# Altium schematic sheet Reg.SchDoc
size A4
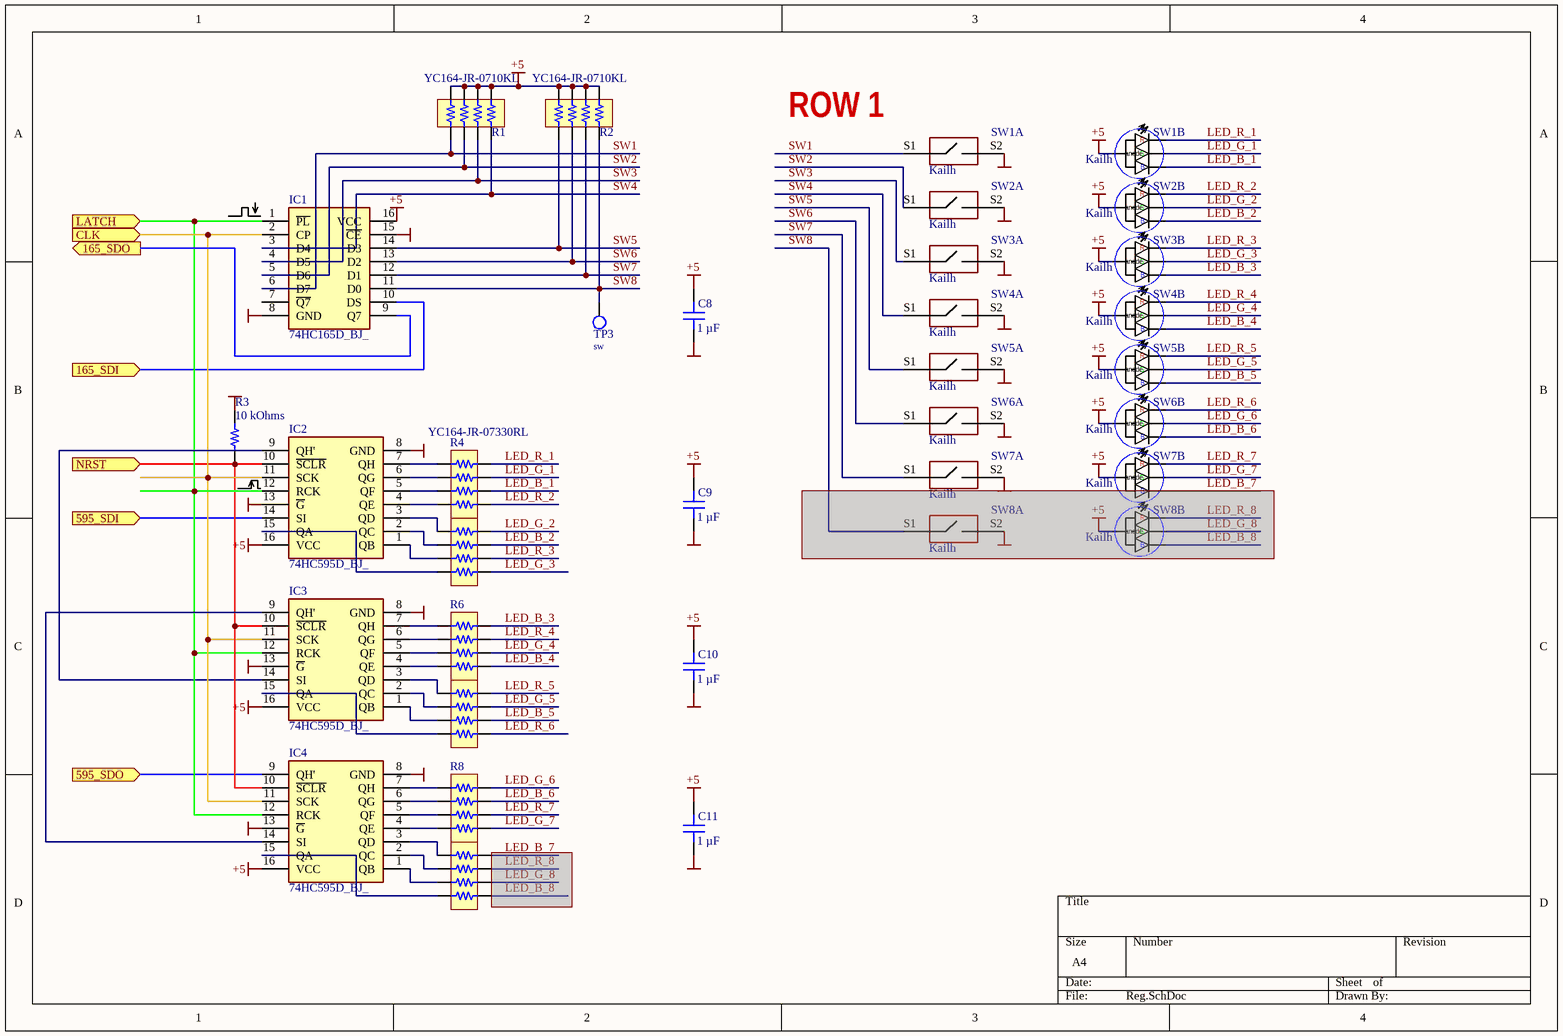
[diagram p0: Reg.SchDoc]

## Parts
C8  1 µF  [CAP 0805_2012]
C9  1 µF  [CAP 0805_2012]
C10  1 µF  [CAP 0805_2012]
C11  1 µF  [CAP 0805_2012]
IC1  74HC165D_BJ_  [SOIC127P600X175-16N]
IC2  74HC595D_BJ_  [SOIC127P600X175-16N]
IC3  74HC595D_BJ_  [SOIC127P600X175-16N]
IC4  74HC595D_BJ_  [SOIC127P600X175-16N]
R1  YC164-JR-0710KL  [RESNET 1206-8 CONVEX]
R2  YC164-JR-0710KL  [RESNET 1206-8 CONVEX]
R3  10 kOhms  [RES 0603_1608]
R4  YC164-JR-07330RL  [RESNET 1206-8 CONVEX]
R5  YC164-JR-07330RL  [RESNET 1206-8 CONVEX]  (value not drawn)
R6  YC164-JR-07330RL  [RESNET 1206-8 CONVEX]  (value not drawn)
R7  YC164-JR-07330RL  [RESNET 1206-8 CONVEX]  (value not drawn)
R8  YC164-JR-07330RL  [RESNET 1206-8 CONVEX]  (value not drawn)
R9  YC164-JR-07330RL  [RESNET 1206-8 CONVEX]  (value not drawn)
SW1  Kailh  [KAILH_MX_SOCKET_smdRGB]  (parts A,B of 2)
SW2  Kailh  [KAILH_MX_SOCKET_smdRGB]  (parts A,B of 2)
SW3  Kailh  [KAILH_MX_SOCKET_smdRGB]  (parts A,B of 2)
SW4  Kailh  [KAILH_MX_SOCKET_smdRGB]  (parts A,B of 2)
SW5  Kailh  [KAILH_MX_SOCKET_smdRGB]  (parts A,B of 2)
SW6  Kailh  [KAILH_MX_SOCKET_smdRGB]  (parts A,B of 2)
SW7  Kailh  [KAILH_MX_SOCKET_smdRGB]  (parts A,B of 2)
SW8  Kailh  [KAILH_MX_SOCKET_smdRGB]  (parts A,B of 2)  (masked out: inside a compile mask, not in the netlist)
TP3  sw  [TESTPOINT_VIA]

## Ports
165_SDI (in), 165_SDO (out), 595_SDI (in), 595_SDO (in), CLK (in), LATCH (in), NRST (in)

## Nets
+5: C8.2 C9.2 C10.2 C11.2 IC1.16(VCC) IC2.16(VCC) IC3.16(VCC) IC4.16(VCC) R1.5 R1.6 R1.7 R1.8 R2.5 R2.6 R2.7 R2.8 SW1.3(anode) SW2.3(anode) SW3.3(anode) SW4.3(anode) SW5.3(anode) SW6.3(anode) SW7.3(anode)
GND: C8.1 C9.1 C10.1 C11.1 IC1.8(GND) IC1.15(~{CE}) IC2.8(GND) IC2.13(~{G}) IC3.8(GND) IC3.13(~{G}) IC4.8(GND) IC4.13(~{G}) R3.2 SW1.S2 SW2.S2 SW3.S2 SW4.S2 SW5.S2 SW6.S2 SW7.S2
165_SDI: IC1.10(DS) ; port 165_SDI
165_SDO: IC1.9(Q7) ; port 165_SDO
595_SDI: IC2.14(SI) ; port 595_SDI
595_SDO: IC4.9(QH') ; port 595_SDO
CLK: IC1.2(CP) IC2.11(SCK) IC3.11(SCK) IC4.11(SCK) ; port CLK
LATCH: IC1.1(~{PL}) IC2.12(RCK) IC3.12(RCK) IC4.12(RCK) ; port LATCH
LED_B_1: R4.2 SW1.4(B)
LED_B_2: R5.3 SW2.4(B)
LED_B_3: R6.4 SW3.4(B)
LED_B_4: R6.1 SW4.4(B)
LED_B_5: R7.2 SW5.4(B)
LED_B_6: R8.3 SW6.4(B)
LED_G_1: R4.3 SW1.2(G)
LED_G_2: R5.4 SW2.2(G)
LED_G_3: R5.1 SW3.2(G)
LED_G_4: R6.2 SW4.2(G)
LED_G_5: R7.3 SW5.2(G)
LED_G_6: R8.4 SW6.2(G)
LED_G_7: R8.1 SW7.2(G)
LED_R_1: R4.4 SW1.1(R)
LED_R_2: R4.1 SW2.1(R)
LED_R_3: R5.2 SW3.1(R)
LED_R_4: R6.3 SW4.1(R)
LED_R_5: R7.4 SW5.1(R)
LED_R_6: R7.1 SW6.1(R)
LED_R_7: R8.2 SW7.1(R)
NRST: IC2.10(~{SCLR}) IC3.10(~{SCLR}) IC4.10(~{SCLR}) R3.1 ; port NRST
SW1: IC1.6(D7) R1.1 SW1.S1
SW2: IC1.5(D6) R1.2 SW2.S1
SW3: IC1.4(D5) R1.3 SW3.S1
SW4: IC1.3(D4) R1.4 SW4.S1
SW5: IC1.14(D3) R2.1 SW5.S1
SW6: IC1.13(D2) R2.2 SW6.S1
SW7: IC1.12(D1) R2.3 SW7.S1
SW8: IC1.11(D0) R2.4 TP3.1
NetIC2_1: IC2.1(QB) R5.7
NetIC2_2: IC2.2(QC) R5.6
NetIC2_3: IC2.3(QD) R5.5
NetIC2_4: IC2.4(QE) R4.8
NetIC2_5: IC2.5(QF) R4.7
NetIC2_6: IC2.6(QG) R4.6
NetIC2_7: IC2.7(QH) R4.5
NetIC2_9: IC2.9(QH') IC3.14(SI)
NetIC2_15: IC2.15(QA) R5.8
NetIC3_1: IC3.1(QB) R7.7
NetIC3_2: IC3.2(QC) R7.6
NetIC3_3: IC3.3(QD) R7.5
NetIC3_4: IC3.4(QE) R6.8
NetIC3_5: IC3.5(QF) R6.7
NetIC3_6: IC3.6(QG) R6.6
NetIC3_7: IC3.7(QH) R6.5
NetIC3_9: IC3.9(QH') IC4.14(SI)
NetIC3_15: IC3.15(QA) R7.8
NetIC4_1: IC4.1(QB) R9.7
NetIC4_2: IC4.2(QC) R9.6
NetIC4_3: IC4.3(QD) R9.5
NetIC4_4: IC4.4(QE) R8.8
NetIC4_5: IC4.5(QF) R8.7
NetIC4_6: IC4.6(QG) R8.6
NetIC4_7: IC4.7(QH) R8.5
NetIC4_15: IC4.15(QA) R9.8

Not connected (* = marked no-connect by the designer): IC1 7(~{Q7}); R9 1 2 3 4; SW7 4(B)

## Notes on the sheet
- ROW 1

## Library data of the parts
C8-C11 = C0805C105K4RAC7800: CAP CER 1UF 16V X7R 0805; manufacturer: KEMET; Tolerance: ±10%; Part Number: C0805C105K4RAC7800; Value: 1 µF; Applications: Bypass, Decoupling; Capacitance: 1 µF; componentlink1description: Datasheet; componentlink1url: https://api.kemet.com/component-edge/download/datasheet/C0805C105K4RACTU.pdf; componentlink2description: DigiKey Link; componentlink2url: https://www.digikey.com/en/products/detail/kemet/C0805C105K4RAC7800/416047; Device Package: 0805 (2012 Metric); lastupdated: 9/19/2022 1:03:30 PM; Lifecycle Status: Active; Minimum Order: 1; Mounting Type: Surface Mount, MLCC; Operating Temperature: -55°C ~ 125°C; Package / Case: 0805 (2012 Metric); packaging: TapeAndReel; partid: 32075; Part Status: Active; price: 0.01; series: SMD Comm X7R; Size / Dimension: 0.079" L x 0.049" W (2.00mm x 1.25mm); Supplier 1: DigiKey; Supplier Part Number 1: 399-C0805C105K4RAC7800CT-ND; Temperature Coefficient: X7R; Thickness (Max): 0.039" (1.00mm); Voltage - Rated: 16V
IC1 = 74HC165D_BJ_: Integrated Circuit; Manufacturer_Name: Toshiba; Manufacturer_Part_Number: 74HC165D(BJ); Datasheet Link: https://www.arrow.com/en/products/74hc165d-bj/toshiba?region=nac; Height: 1.75mm; Mouser Part Number: 757-74HC165DBJ; Mouser Price/Stock: https://www.mouser.co.uk/ProductDetail/Toshiba/74HC165DBJ?qs=lQAVKuKFhkJom8fGze1o7Q%3D%3D; Arrow Part Number: 74HC165D(BJ); Arrow Price/Stock: https://www.arrow.com/en/products/74hc165d-bj/toshiba?region=nac
IC2-IC4 = 74HC595D_BJ_: Integrated Circuit; Manufacturer_Name: Toshiba; Manufacturer_Part_Number: 74HC595D(BJ); Datasheet Link: https://componentsearchengine.com/Datasheets/1/74HC595D(BJ).pdf; Height: 1.75mm; Mouser Part Number: 757-74HC595DBJ; Mouser Price/Stock: https://www.mouser.co.uk/ProductDetail/Toshiba/74HC595DBJ?qs=T%2FywbITssnTkqd02WdSNRg%3D%3D; Arrow Part Number: 74HC595D(BJ); Arrow Price/Stock: https://www.arrow.com/en/products/74hc595d-bj/toshiba?region=nac
R1 R2 = YC164-JR-0710KL: RES ARRAY 4 RES 10K OHM 1206; Manufacturer: Yageo; Circuit Type: Isolated; Number of Resistors: 4; Power Per Element: 62.5mW; Temperature Coefficient: ±200ppm/°C; Tolerance: ±5%; Part Number: YC164-JR-0710KL; Applications: DDRAM, SDRAM; ComponentLink1Description: Datasheet; ComponentLink1URL: https://www.yageo.com/upload/media/product/productsearch/datasheet/rchip/PYu-YC_TC_group_51_RoHS_L_9.pdf; ComponentLink2Description: DigiKey Link; ComponentLink2URL: http://digikey.com/product-detail/en/yageo/YC164-JR-0710KL/YC164J-10KCT-ND/1005702; Height - Seated (Max): 0.028" (0.70mm); LastUpdated: 02.09.2020 1:23:24; Lifecycle Status: Active; Minimum Order: 1; Mounting Type: Surface Mount; Number of Pins: 8; Operating Temperature: -55°C ~ 155°C; Package / Case: 1206 (3216 Metric), Convex, Long Side Terminals; Packaging: TapeAndReel; PartId: 146; Part Status: Active; Price: 0.01; Resistance (Ohms): 10k; Series: YC164; Size / Dimension: 0.126" L x 0.063" W (3.20mm x 1.60mm); Supplier 1: DigiKey; Supplier Part Number 1: YC164J-10KCT-ND
R3 = ERJ-3EKF1002V: RES SMD 10K OHM 1% 1/10W 0603; Manufacturer: Panasonic Electronic Components; Power (Watts): 0.1W, 1/10W; Temperature Coefficient: ±100ppm/°C; Part Number: ERJ-3EKF1002V; Value: 10 kOhms; ComponentLink1Description: Datasheet; ComponentLink1URL: https://industrial.panasonic.com/cdbs/www-data/pdf/RDA0000/AOA0000C304.pdf; ComponentLink2Description: DigiKey Link; ComponentLink2URL: https://www.digikey.com/en/products/detail/panasonic-electronic-components/ERJ-3EKF1002V/196066; Composition: Thick Film; Device Package: 0603 (1608 Metric); Height - Seated (Max): 0.022" (0.55mm); LastUpdated: 2/9/2024 8:41:59 PM; Lifecycle Status: Active; Minimum Order: 1; Number of Terminations: 2; Operating Temperature: -55°C ~ 155°C; Package / Case: 0603 (1608 Metric); Packaging: TapeAndReel; PartId: 25695; Part Status: Active; Price: 0.01; Resistance: 10 kOhms; Series: ERJ-3EK; Size / Dimension: 0.063" L x 0.031" W (1.60mm x 0.80mm); Supplier 1: DigiKey; Supplier Part Number 1: P10.0KHCT-ND; Supplier Device Package: 0603; Tolerance: ±1%; Features: Automotive AEC-Q200; Ratings: AEC-Q200
R4-R9 = YC164-JR-07330RL: RES ARRAY 4 RES 330 OHM 1206; Manufacturer: Yageo; Circuit Type: Isolated; Number of Resistors: 4; Power Per Element: 62.5mW; Resistance (Ohms): 330; Temperature Coefficient: ±200ppm/°C; Tolerance: ±5%; Part Number: YC164-JR-07330RL; Applications: DDRAM, SDRAM; ComponentLink1Description: Datasheet; ComponentLink1URL: https://www.yageo.com/upload/media/product/productsearch/datasheet/rchip/PYu-YC_TC_group_51_RoHS_L_9.pdf; ComponentLink2Description: DigiKey Link; ComponentLink2URL: http://digikey.com/product-detail/en/yageo/YC164-JR-07330RL/YC164J-330CT-ND/1005668; Height - Seated (Max): 0.028" (0.70mm); LastUpdated: 9/2/2020 1:23:24 AM; Lifecycle Status: Active; Minimum Order: 1; Mounting Type: Surface Mount; Number of Pins: 8; Operating Temperature: -55°C ~ 155°C; Package / Case: 1206 (3216 Metric), Convex, Long Side Terminals; Packaging: TapeAndReel; PartId: 236; Part Status: Active; Price: 0.01; Series: YC164; Size / Dimension: 0.126" L x 0.063" W (3.20mm x 1.60mm); Supplier 1: DigiKey; Supplier Part Number 1: YC164J-330CT-ND
SW1-SW8 = Kailh_hotswap_RGB_SMD: Kailh keyboard switch, hotswap rgb, dual-side hotswap options + low prifile variant
TP3 = TestPoint